# Altium schematic sheet RTC.SchDoc
size A4; SheetNumber: 5; SheetTotal: 5
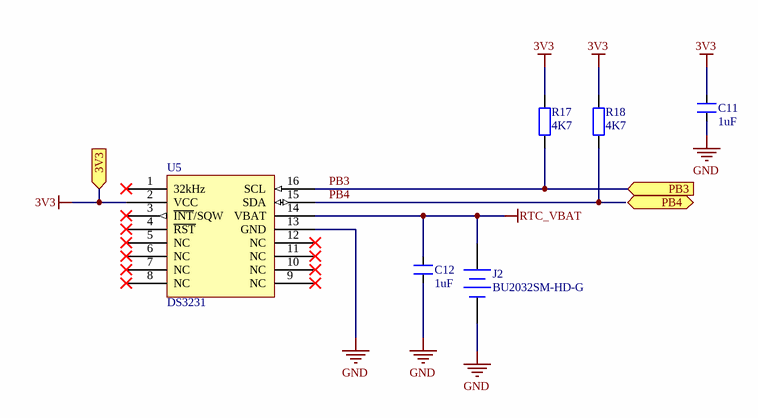
[diagram p0: RTC.SchDoc]

## Parts
C11  1uF  [SM-0805]
C12  1uF  [SM-0805]
J2  BU2032SM-HD-G  [BATTERY HOLDER_BU2032SM-HD-G]
R17  4K7  [RES-SMD-0805]
R18  4K7  [RES-SMD-0805]
U5  DS3231  [SL3016]

## Ports
3V3 (in), PB3 (in), PB4 (bidir)

## Nets
3V3: C11.2 R17.2 R18.2 U5.2(VCC) ; port 3V3
GND: C11.1 C12.1 J2.2(-) U5.13(GND)
RTC_VBAT: C12.2 J2.1(+) U5.14(VBAT)
PB3: R17.1 U5.16(SCL) ; port PB3
PB4: R18.1 U5.15(SDA)

Not connected (* = marked no-connect by the designer): U5 1(32kHz)* 3(~{INT}/SQW)* 4(~{RST})* 5(NC)* 6(NC)* 7(NC)* 8(NC)* 9(NC)* 10(NC)* 11(NC)* 12(NC)*

## Notes on the sheet
- Title
- Size:
- Date:
- Author:
- CC2538 DEVELOPMENT KIT
- A4
- Phan Chuong
- Time:
- Number:
- Checked:
- Revision:
- Sheet
- Draw by
- of
- DATN

## Library data of the parts
C11 C12 = CM: Cap SMD; Value: 103
J2 = BATTERY HOLDER_BU2032SM-HD-G: HOLDER COIN CELL 2032 SMD; Manufacturer: MPD (Memory Protection Devices); Battery Type, Function: Coin Cell, Holder; Style: Holder (Open); Battery Cell Size: Coin, 20.0mm; Number of Cells: 1; Battery Series: 2032; Supplier 1: Digi-Key; Manufacturer Part Number: BU2032SM-HD-G; RoHS: RoHS Compliant; Category: Battery Products; Stock 1: 72564; Pricing 1: 1=0.89, 10=0.828 (USD); Part Status: Active; Mounting Type: PCB, Surface Mount; Termination Style: SMD (SMT) Tab; Height Above Board: 0.208" (5.28mm); Operating Temperature: -40°C ~ 280°C; ComponentLink1URL: http://www.memoryprotectiondevices.com/datasheets/BU2032SM-HD-G-datasheet.pdf; ComponentLink1Description: http://www.memoryprotectiondevices.com/datasheets/BU2032SM-HD-G-datasheet.pdf; Supplier Part Number 1: BU2032SM-HD-GDKR-ND
R17 R18 = R: Resistor R1/4W